# Altium schematic sheet Sheet_1_2026-10-20.schdoc
size 129 x 49 mm
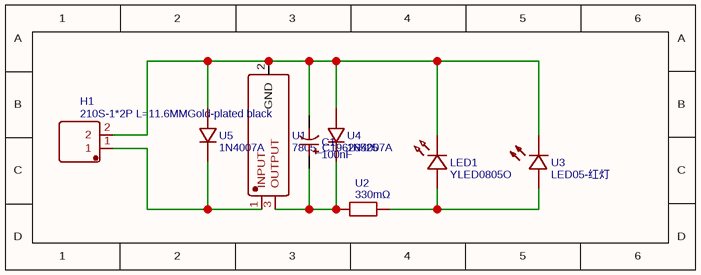
[diagram p0: Sheet_1_2026-10-20.schdoc]

## Parts
C1  100nF  [CAP-SMD_L2.2-W1.3-RD]
H1  210S-1*2P L=11.6MMGold-plated black  [HDR-TH_2P-P2.54-V-M-1]
LED1  YLED0805O  [LED0805-FD-GREEN]
U1  7805_C19626525  [TO-252-2_L6.6-W6.1-P4.57-LS9.9-BR-CW]
U2  330mΩ  [RES-TH_BD2.3-L6.5-P10.50-D0.5]
U3  LED05-红灯  [LED-TH_LED-3MM_RED]
U4  1N4007A  [DO-41_BD2.4-L4.7-P8.70-D0.9-RD]
U5  1N4007A  [DO-41_BD2.4-L4.7-P8.70-D0.9-RD]

## Nets
NetC1_1: C1.1 H1.2 LED1.2(C) U1.2(GND) U3.2 U4.2 U5.2
NetC1_2: C1.2 U1.3(OUTPUT) U2.1 U4.1
NetH1_1: H1.1 U1.1(INPUT) U5.1
NetLED1_1: LED1.1(A) U2.2 U3.1

## Library data of the parts
C1 = 100nF: Manufacturer: VISHAY(威世); Manufacturer Part: 195D104X0002C2T; nameAlias: Value; Contributor: lcsc; Supplier: LCSC; Supplier Part: C1960784; JLCPCB Part Class: Extended Part; spicePre: C; spiceSymbolName: 195D104X0002C2T
H1 = 210S-1*2P L=11.6MMGold-plated black: Manufacturer: Ckmtw(灿科盟); Manufacturer Part: B-2100S02P-A110; Contributor: LCSC; Supplier: LCSC; Supplier Part: C124375; JLCPCB Part Class: Extended Part; spicePre: H; spiceSymbolName: 210S-1*2P L=11.6MMGold-plated black
LED1 = YLED0805O: Manufacturer: YONGYUTAI(永裕泰); Contributor: lcsc; Supplier: LCSC; Supplier Part: C25170727; Manufacturer Part: YLED0805O; JLCPCB Part Class: Extended Part; spicePre: L; spiceSymbolName: YLED0805O
U1 = 7805_C19626525: Manufacturer: YFW(佑风微); Manufacturer Part: 7805; Contributor: lcsc; Supplier: LCSC; Supplier Part: C19626525; JLCPCB Part Class: Extended Part; spicePre: U; spiceSymbolName: 7805_C19626525
U2 = 330mΩ: Manufacturer: 华星机电; Manufacturer Part: CF1/4W-0.33Ω±5%T52; Contributor: lcsc; nameAlias: Value; Supplier: LCSC; Supplier Part: C714249; JLCPCB Part Class: Extended Part; spicePre: U; spiceSymbolName: CF1/4W-0.33Ω±5%T52
U3 = LED05-红灯: Manufacturer: null; Contributor: LCSC; Supplier: LCSC; Supplier Part: C9900009041; Manufacturer Part: LED05-红灯; JLCPCB Part Class: Extended Part; spicePre: U; spiceSymbolName: LED05-红灯
U4 U5 = 1N4007A: Manufacturer: LRC(乐山无线电); Contributor: lcsc; Supplier: LCSC; Supplier Part: C5336145; Manufacturer Part: 1N4007A; JLCPCB Part Class: Extended Part; spicePre: U; spiceSymbolName: 1N4007A